# Altium schematic sheet Sheet1.SchDoc
size A2; SheetNumber: 1; SheetTotal: 1
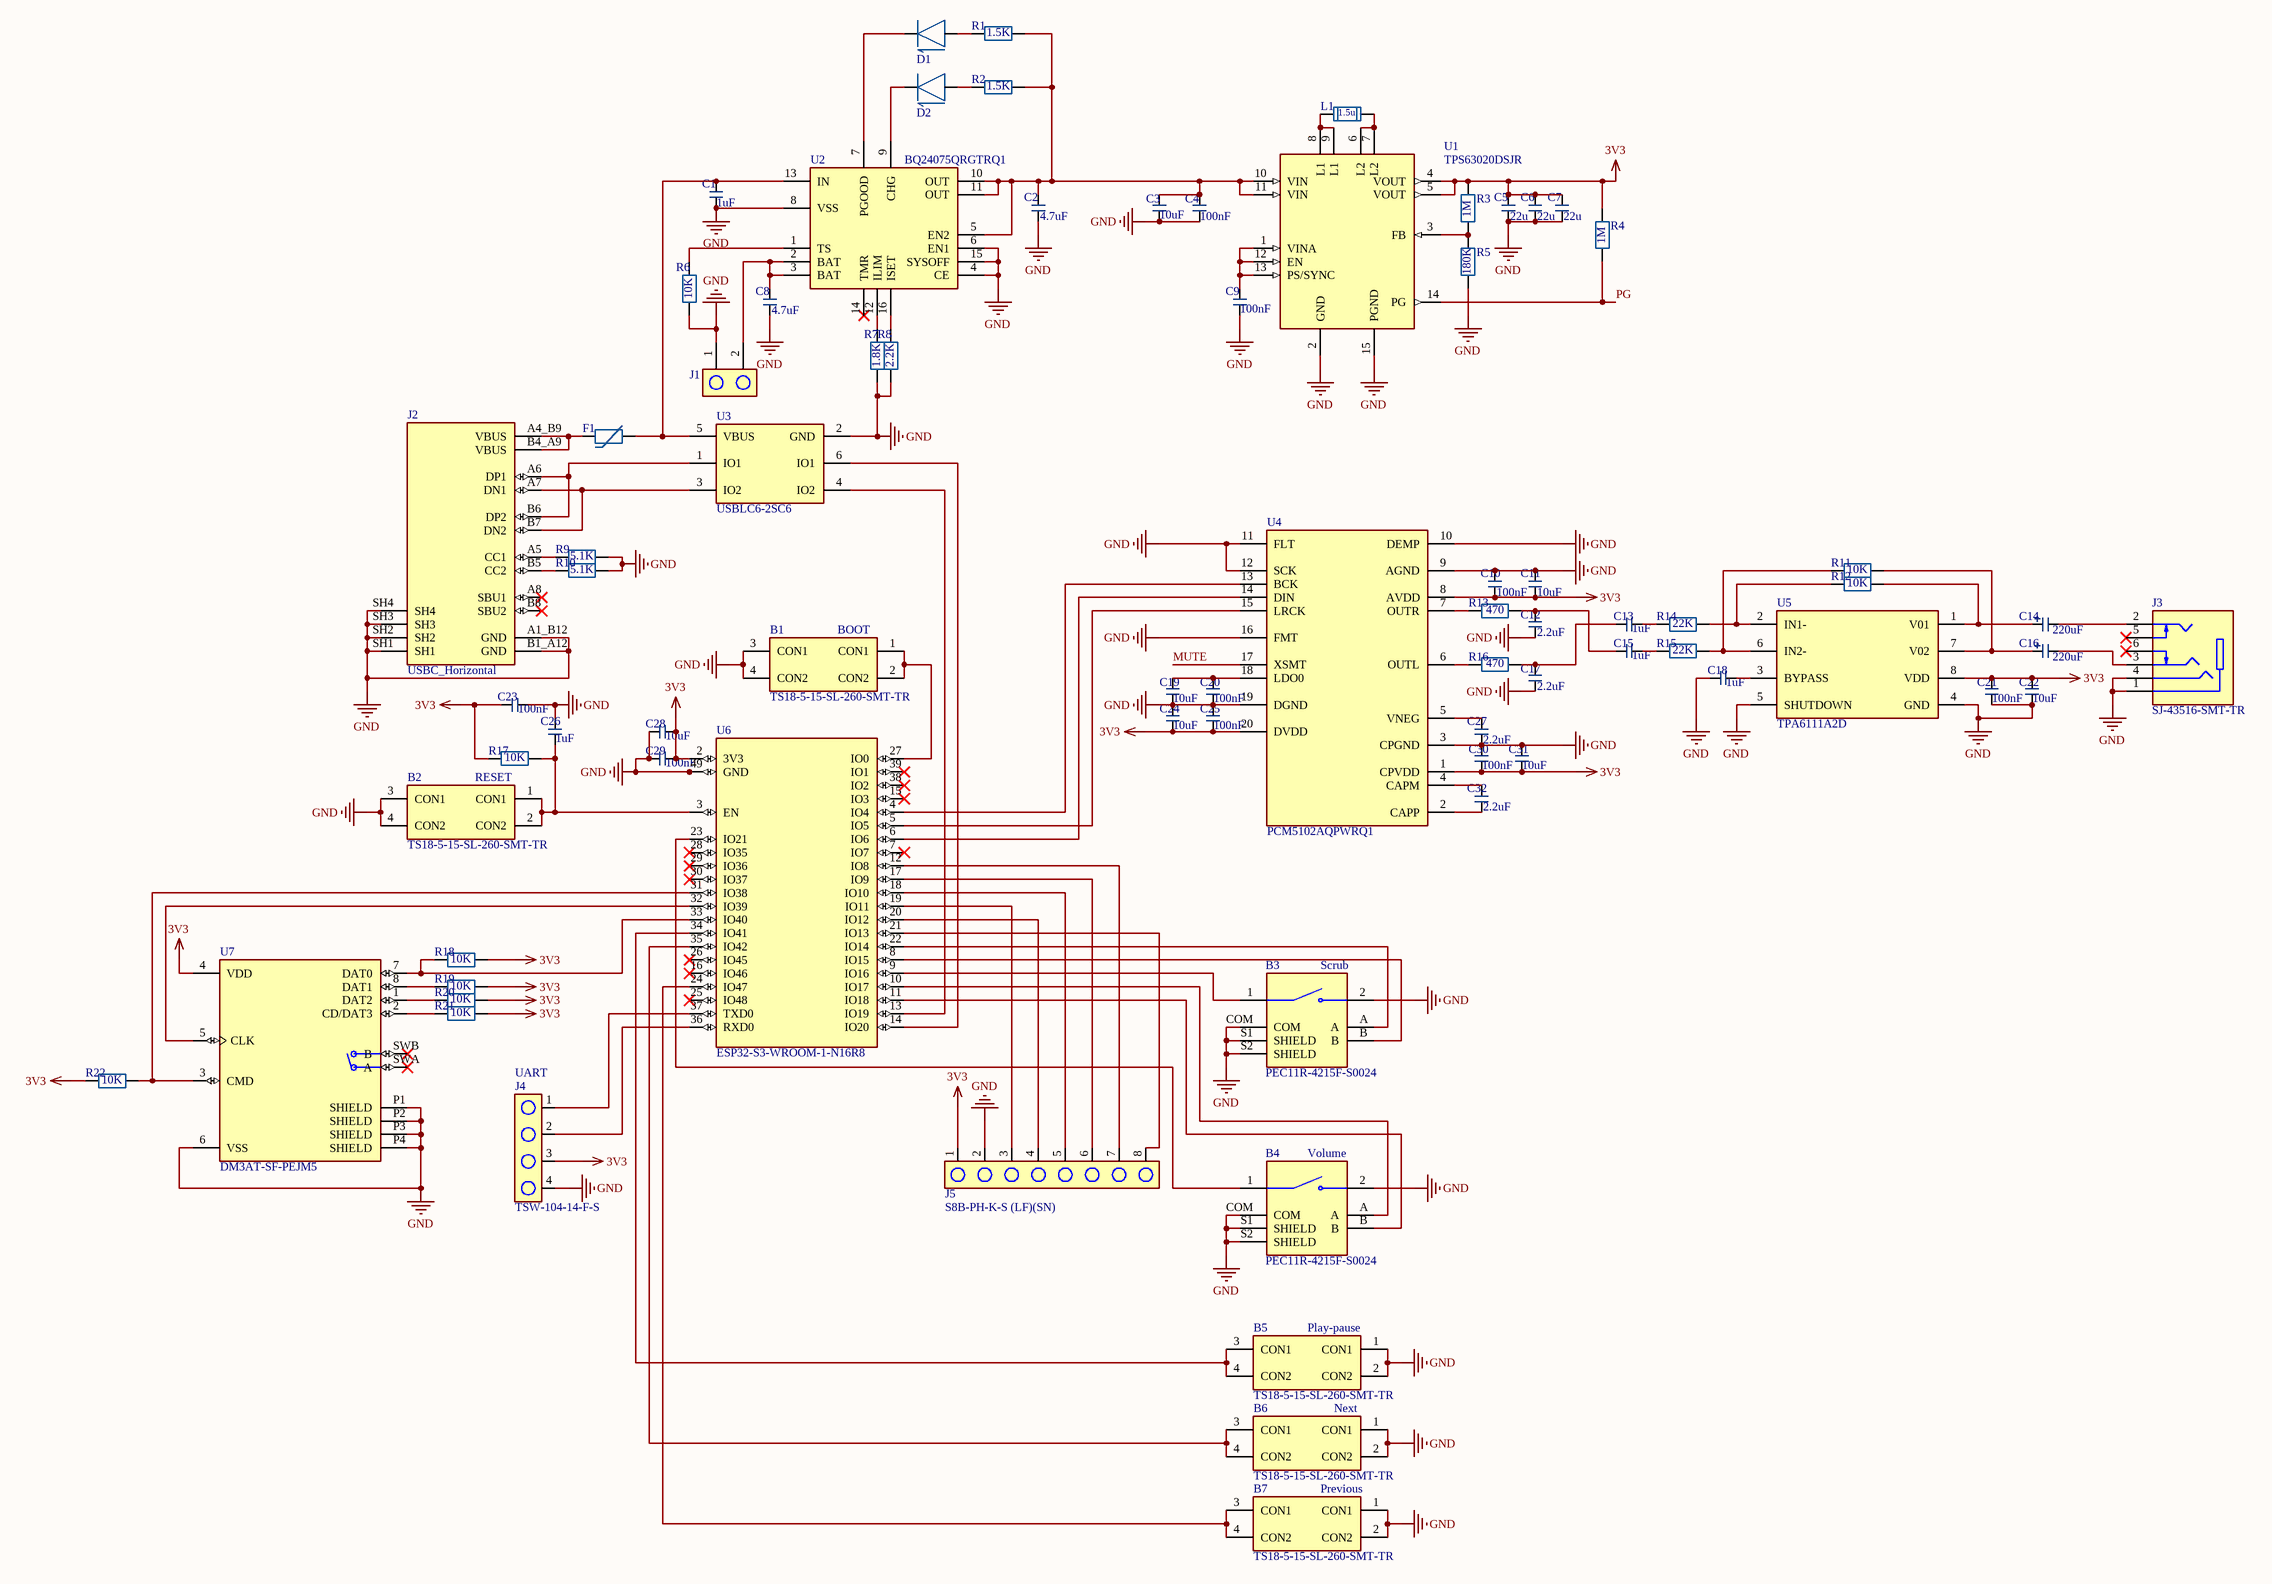
[diagram p0: Sheet1.SchDoc]

## Parts
B1  TS18-5-15-SL-260-SMT-TR  [TS18-5-15-SL-260-SMT-TR]
B2  TS18-5-15-SL-260-SMT-TR  [TS18-5-15-SL-260-SMT-TR]
B3  PEC11R-4215F-S0024  [PEC11R-4215F-S0024]
B4  PEC11R-4215F-S0024  [PEC11R-4215F-S0024]
B5  TS18-5-15-SL-260-SMT-TR  [TS18-5-15-SL-260-SMT-TR]
B6  TS18-5-15-SL-260-SMT-TR  [TS18-5-15-SL-260-SMT-TR]
B7  TS18-5-15-SL-260-SMT-TR  [TS18-5-15-SL-260-SMT-TR]
C1  1uF  [CAP_0603]
C2  4.7uF  [CAP_0603]
C3  10uF  [CAP_0603]
C4  100nF  [CAP_0603]
C5  22u  [CAP_0603]
C6  22u  [CAP_0603]
C7  22u  [CAP_0603]
C8  4.7uF  [CAP_0603]
C9  100nF  [CAP_0603]
C10  100nF  [CAP_0603]
C11  10uF  [CAP_0603]
C12  2.2uF  [CAP_0603]
C13  1uF  [CAP_0603]
C14  220uF  [865080345012_AluminiumCap]
C15  1uF  [CAP_0603]
C16  220uF  [865080345012_AluminiumCap]
C17  2.2uF  [CAP_0603]
C18  1uF  [CAP_0603]
C19  10uF  [CAP_0603]
C20  100nF  [CAP_0603]
C21  100nF  [CAP_0603]
C22  10uF  [CAP_0603]
C23  100nF  [CAP_0603]
C24  10uF  [CAP_0603]
C25  100nF  [CAP_0603]
C26  1uF  [CAP_0603]
C27  2.2uF  [CAP_0603]
C28  10uF  [CAP_0603]
C29  100nF  [CAP_0603]
C30  100nF  [CAP_0603]
C31  10uF  [CAP_0603]
C32  2.2uF  [CAP_0603]
D1  SML-LXIL0603SIC-TR  [LED_0603]  (value not drawn)
D2  SML-LXIL0603SIC-TR  [LED_0603]  (value not drawn)
F1  MF-PSMF050X-2  [MF-PSMF050X]  (value not drawn)
J1  TSW-102-07-G-S  [TSW-102-07-G-S]  (value not drawn)
J2  USBC_Horizontal  [USBC_Horizontal]
J3  SJ-43516-SMT-TR  [SJ-43516-SMT-TR]
J4  TSW-104-14-F-S  [TSW-104-14-F-S]
J5  S8B-PH-K-S (LF)(SN)  [S8B-PH-K-S (LF)(SN)]
L1  1.5u  [IND_0603]
R1  1.5K  [RES_0603]
R2  1.5K  [RES_0603]
R3  1M  [RES_0603]
R4  1M  [RES_0603]
R5  180K  [RES_0603]
R6  10K  [RES_0603]
R7  1.8K  [RES_0603]
R8  2.2K  [RES_0603]
R9  5.1K  [RES_0603]
R10  5.1K  [RES_0603]
R11  10K  [RES_0603]
R12  10K  [RES_0603]
R13  470  [RES_0603]
R14  22K  [RES_0603]
R15  22K  [RES_0603]
R16  470  [RES_0603]
R17  10K  [RES_0603]
R18  10K  [RES_0603]
R19  10K  [RES_0603]
R20  10K  [RES_0603]
R21  10K  [RES_0603]
R22  10K  [RES_0603]
U1  TPS63020DSJR  [TPS63020DSJR]
U2  BQ24075QRGTRQ1  [BQ24075QRGTRQ1]
U3  USBLC6-2SC6  [USBLC6-2SC6]
U4  PCM5102AQPWRQ1  [PCM5102AQPWRQ1]
U5  TPA6111A2D  [TPA6111A2D]
U6  ESP32-S3-WROOM-1-N16R8  [ESP32-S3-WROOM-1-N16R8]
U7  DM3AT-SF-PEJM5

## Nets
3V3: C5.2 C6.2 C7.2 C10.1 C11.1 C21.1 C22.2 C23.1 C24.1 C25.1 C28.2 C29.2 C30.1 C31.1 J4.3 J5.1 R3.2 R4.2 R17.1 R18.2 R19.1 R20.1 R21.1 R22.1 U1.4(VOUT) U1.5(VOUT) U4.1(CPVDD) U4.8(AVDD) U4.20(DVDD) U5.8(VDD) U6.2(3V3) U7.4(VDD)
GND: B1.3(CON1) B1.4(CON2) B2.3(CON1) B2.4(CON2) B3.2 B3.COM B3.S1(SHIELD) B3.S2(SHIELD) B4.2 B4.COM B4.S1(SHIELD) B4.S2(SHIELD) B5.1(CON1) B5.2(CON2) B6.1(CON1) B6.2(CON2) B7.1(CON1) B7.2(CON2) C1.1 C2.1 C3.1 C4.1 C5.1 C6.1 C7.1 C8.1 C9.1 C10.2 C11.2 C12.1 C17.1 C18.1 C19.1 C20.1 C21.2 C22.1 C23.2 C24.2 C25.2 C26.2 C27.1 C28.1 C29.1 C30.2 C31.2 J1.1 J2.A1_B12(GND) J2.B1_A12(GND) J2.SH1 J2.SH2 J2.SH3 J2.SH4 J3.1 J3.4 J4.4 J5.2 R5.1 R6.1 R7.1 R8.1 R9.2 R10.2 U1.2(GND) U1.15(PGND) U2.4(CE) U2.6(EN1) U2.8(VSS) U2.15(SYSOFF) U3.2(GND) U4.3(CPGND) U4.9(AGND) U4.10(DEMP) U4.11(FLT) U4.12(SCK) U4.16(FMT) U4.19(DGND) U5.4(GND) U5.5(SHUTDOWN) U6.1(GND) U6.40(GND) U6.41(GND) U6.42(GND) U6.43(GND) U6.44(GND) U6.45(GND) U6.46(GND) U6.47(GND) U6.48(GND) U6.49(GND) U7.6(VSS) U7.P1(SHIELD) U7.P2(SHIELD) U7.P3(SHIELD) U7.P4(SHIELD)
MUTE: U4.17(XSMT)
PG: R4.1 U1.14(PG)
NetB1_1: B1.1(CON1) B1.2(CON2) U6.27(IO0)
NetB2_1: B2.1(CON1) B2.2(CON2) C26.1 R17.2 U6.3(EN)
NetB3_1: B3.1 U6.9(IO16)
NetB3_A: B3.A U6.22(IO14)
NetB3_B: B3.B U6.8(IO15)
NetB4_1: B4.1 U6.23(IO21)
NetB4_A: B4.A U6.10(IO17)
NetB4_B: B4.B U6.11(IO18)
NetB5_3: B5.3(CON1) B5.4(CON2) U6.34(IO41)
NetB6_3: B6.3(CON1) B6.4(CON2) U6.35(IO42)
NetB7_3: B7.3(CON1) B7.4(CON2) U6.24(IO47)
NetC1_2: C1.2 F1.2 U2.13(IN) U3.5(VBUS)
NetC2_2: C2.2 C3.2 C4.2 R1.2 R2.2 U1.10(VIN) U1.11(VIN) U2.5(EN2) U2.10(OUT) U2.11(OUT)
NetC8_2: C8.2 J1.2 U2.2(BAT) U2.3(BAT)
NetC9_2: C9.2 U1.1(VINA) U1.12(EN) U1.13(PS/SYNC)
NetC12_2: C12.2 C15.1 R13.2
NetC13_1: C13.1 C17.2 R16.2
NetC13_2: C13.2 R14.1
NetC14_1: C14.1 R12.2 U5.1(V01)
NetC14_2: C14.2 J3.2
NetC15_2: C15.2 R15.1
NetC16_1: C16.1 R11.2 U5.7(V02)
NetC16_2: C16.2 J3.3
NetC18_2: C18.2 U5.3(BYPASS)
NetC19_2: C19.2 C20.2 U4.18(LDO0)
NetC27_2: C27.2 U4.5(VNEG)
NetC32_1: C32.1 U4.2(CAPP)
NetC32_2: C32.2 U4.4(CAPM)
NetD1_1: D1.1 R1.1
NetD1_2: D1.2 U2.7(PGOOD)
NetD2_1: D2.1 R2.1
NetD2_2: D2.2 U2.9(CHG)
NetF1_1: F1.1 J2.A4_B9(VBUS) J2.B4_A9(VBUS)
NetJ2_A5: J2.A5(CC1) R9.1
NetJ2_A6: J2.A6(DP1) J2.B6(DP2) U3.1(IO1)
NetJ2_A7: J2.A7(DN1) J2.B7(DN2) U3.3(IO2)
NetJ2_B5: J2.B5(CC2) R10.1
NetJ4_1: J4.1 U6.37(TXD0)
NetJ4_2: J4.2 U6.36(RXD0)
NetJ5_3: J5.3 U6.19(IO11)
NetJ5_4: J5.4 U6.20(IO12)
NetJ5_5: J5.5 U6.18(IO10)
NetJ5_6: J5.6 U6.17(IO9)
NetJ5_7: J5.7 U6.12(IO8)
NetJ5_8: J5.8 U6.21(IO13)
NetL1_1: L1.1 U1.8(L1) U1.9(L1)
NetL1_2: L1.2 U1.6(L2) U1.7(L2)
NetR3_1: R3.1 R5.2 U1.3(FB)
NetR6_2: R6.2 U2.1(TS)
NetR7_2: R7.2 U2.12(ILIM)
NetR8_2: R8.2 U2.16(ISET)
NetR11_1: R11.1 R15.2 U5.6(IN2-)
NetR12_1: R12.1 R14.2 U5.2(IN1-)
NetR13_1: R13.1 U4.7(OUTR)
NetR16_1: R16.1 U4.6(OUTL)
NetR18_1: R18.1 U6.33(IO40) U7.7(DAT0)
NetR19_2: R19.2 U7.8(DAT1)
NetR20_2: R20.2 U7.1(DAT2)
NetR21_2: R21.2 U7.2(CD/DAT3)
NetR22_2: R22.2 U6.31(IO38) U7.3(CMD)
NetU3_4: U3.4(IO2) U6.13(IO19)
NetU3_6: U3.6(IO1) U6.14(IO20)
NetU4_13: U4.13(BCK) U6.4(IO4)
NetU4_14: U4.14(DIN) U6.6(IO6)
NetU4_15: U4.15(LRCK) U6.5(IO5)
NetU6_32: U6.32(IO39) U7.5(CLK)

Not connected (* = marked no-connect by the designer): J2 A8(SBU1)* B8(SBU2)*; J3 5* 6*; U2 14(TMR)*; U6 7(IO7)* 15(IO3)* 16(IO46)* 25(IO48)* 26(IO45)* 28(IO35)* 29(IO36)* 30(IO37)* 38(IO2)* 39(IO1)*; U7 SWA(A)* SWB(B)*

## Notes on the sheet
- (near B1) BOOT
- RESET
- (near B3) Scrub
- (near J4) UART
- (near B4) Volume
- (near B5) Play-pause
- (near B6) Next
- (near B7) Previous

## Library data of the parts
B1 B2 = TS18-5-15-SL-260-SMT-TR: Push-button style, NO; Manufacturer: SameSky; Supplier 1: Mouser; Supplier Part Number 1: 179-TS18515SL260SMTT; Supplier 2: DigiKey; Supplier Part Number 2: 2223-TS18-5-15-SL-260-SMT-TRDKR-ND; Manufacturer Part Number: TS18-5-15-SL-260-SMT-TR
B3 B4 = PEC11R-4215F-S0024: Rotary Encoder; Manufacturer: Bourns; Supplier 1: Mouser; Supplier Part Number 1: 652-PEC11R-4215F-S24; Supplier 2: DigiKey; Supplier Part Number 2: PEC11R-4215F-S0024-ND; Manufacturer Part Number: PEC11R-4215F-S0024
B5-B7 = TS18-5-15-SL-260-SMT-TR: Push-button style, NO
C1 C13 C15 C18 C26 = C_1u_0603: 1 uF 10% 0603 X7R MLCC; Manufacturer: Yageo; Manufacturer Part Number: CC0603KRX7R7BB105; Package (Imperial): 0603; Voltage Rating DC: 16 VDC; Value: 1 uF; Tolerance: 10%; Dielectric: X7R; Datasheet: https://yageogroup.com/component-documentation/download/datasheet/CC0603KRX7R7BB105?lang=en; Supplier 1: Mouser; Supplier Part Number 1: 603-CC603KRX7R7BB105; Supplier 2: DigiKey; Supplier Part Number 2: 311-1446-1-ND
C2 C8 = C_4.7u_0805: 4.7 uF 10% 0805 X7R MLCC; Manufacturer: Yageo (KEMET); Manufacturer Part Number: C0805C475K3RAC7210; Package (Imperial): 0805; Voltage Rating DC: 16 VDC; Value: 4.7 uF; Tolerance: 10%; Dielectric: X7R; Datasheet: https://yageogroup.com/component-documentation/download/datasheet/C0805C475K4RACTM?lang=en; Supplier 1: Mouser; Supplier Part Number 1: 80-C0805C475K3RACLR; Supplier 2: DigiKey; Supplier Part Number 2: 399-C0805C475K3RAC7210TR-ND
C3 C19 C22 C24 C31 = C_10u_0805: 10 uF 10% 0805 X7R MLCC; Manufacturer Part Number: C0805C106K8RACTU; Manufacturer: Yageo; Package (Imperial): 0805; Voltage Rating DC: 10 VDC; Tolerance: 10%; Dielectric: X7R; Datasheet: https://yageogroup.com/component-documentation/download/datasheet/C0805C106K8RACTU?lang=en; Value: 10 uF; Supplier 1: Mouser; Supplier Part Number 1: 80-C0805C106K8R; Supplier 2: DigiKey; Supplier Part Number 2: 399-C0805C106K8RACTUCT-ND
C4 C9 C10 C20 C21 C23 C25 C29 C30 = C_100n_0603: 100 nF 1% 0603 X7R MLCC; Manufacturer: Yageo; Manufacturer Part Number: CC0603KRX7R9BB104; Package (Imperial): 0603; Voltage Rating DC: 50 VDC; Value: 100 nF; Tolerance: 1%; Dielectric: X7R; Datasheet: https://yageogroup.com/component-documentation/download/datasheet/CC0603KRX7R9BB104?lang=en
  C4: Supplier 1: Mouser; Supplier Part Number 1: 603-CC603KRX7R9BB104; Supplier 2: DigiKey; Supplier Part Number 2: 311-1344-6-ND
C5-C7 = C_22u_0603: 22 uF 20% 0603 X5R MLCC; Manufacturer: Yageo; Manufacturer Part Number: CC0603MRX5R6BB226; Value: 22 uF; Package (Imperial): 0603; Voltage Rating DC: 10 VDC; Tolerance: 20%; Dielectric: X5R; ComponentLink1Description: Datasheet; ComponentLink1URL: https://yageogroup.com/component-documentation/download/datasheet/CC0603MRX5R6BB226?lang=en; Supplier 1: Mouser; Supplier Part Number 1: 603-CC603MRX5R6BB226; Supplier 2: DigiKey; Supplier Part Number 2: 311-1819-1-ND
C11 C28 = C_10u_0805: 10 uF 10% 0805 X7R MLCC; Manufacturer: Yageo; Manufacturer Part Number: C0805C106K8RACTU; Package (Imperial): 0805; Voltage Rating DC: 10 VDC; Value: 10 uF; Tolerance: 10%; Dielectric: X7R; Datasheet: https://yageogroup.com/component-documentation/download/datasheet/C0805C106K8RACTU?lang=en
C12 C17 C27 C32 = C_2.2u_0603: 2.2 uF 10% 0603 X7R MLCC; Manufacturer: Yageo; Manufacturer Part Number: CC0603KRX7R7BB225; Package (Imperial): 0603; Voltage Rating DC: 16 VDC; Value: 2.2 uF; Tolerance: 10%; Dielectric: X7R; Datasheet: *
  C12 C17: Supplier 1: Mouser; Supplier Part Number 1: 603-CC0603KRX77BB225; Supplier 2: DigiKey; Supplier Part Number 2: 311-3490-6-ND
C14 C16 = C_220u_ALUMINIUM: 220 uF 20% Radial Electrolytic Aluminium Capacitor; Manufacturer: Wurth Elektronik; Manufacturer Part Number: 865080345012; Package (Imperial): Radial, Can - SMD; Voltage Rating DC: 16 V; Value: 220 uF; Tolerance: 20%; Dielectric: Electrolytic; ComponentLink1Description: Datasheet; ComponentLink1URL: https://www.we-online.com/components/products/datasheet/865080345012.pdf; Supplier 1: Mouser; Supplier Part Number 1: 710-865080345012; Supplier 2: DigiKey; Supplier Part Number 2: 732-8422-1-ND
D1 D2 = SML-LXIL0603SIC-TR: Single Color Red LED 0603; Manufacturer: Lumex; Wavelength: 630 nm; Manufacturer Part Number: SML-LXIL0603SIC-TR; Package: 0603; Supplier 1: Mouser; Supplier Part Number 1: 696-SMLLXIL0603SICTR; Supplier 2: DigiKey; Supplier Part Number 2: 67-2333-1-ND; ComponentLink1Description: Datasheet; ComponentLink1URL: https://www.lumex.com/datasheet/files/SML-LX0603IW-TR.pdf
F1 = MF-PSMF050X-2: PPTC 1V 0.5A; Manufacturer: Bourns; Package (Imperial): 0805; Hold Current: 500 mA; Trip Current: 1 A; Maximum Current: 40 A; Maximum Voltage: 6 VDC; Manufacturer Part Number: MF-PSMF050X-2; Termination: Recessed SMD; Supplier 1: Mouser; Supplier Part Number 1: 652-MF-PSMF050X-2; Supplier 2: DigiKey; Supplier Part Number 2: MF-PSMF050X-2CT-ND
J1 = TSW-102-07-G-S: 1x2 Headers 2.54 Pitch; Manufacturer: Samtec; Number of Positions: 2; Pitch: 2.54 mm; Manufacturer Part Number: TSW-102-07-G-S; Number of Rows: 1; Supplier 1: Mouser; Supplier Part Number 1: 200-TSW10207GS; Supplier 2: DigiKey; Supplier Part Number 2: 612-TSW-102-07-G-S-ND; ComponentLink1Description: Datasheet; ComponentLink1URL: https://www.mouser.in/datasheet/3/85/1/htsw_th.pdf
J2 = USBC_Horizontal: USB-C, USB-2.0 SMD 16 contacts, horizontal; Manufacturer: GCT; Manufacturer Part Number: USB4105GFA; Number of Contacts: 16; Current Rating: 5 A; Voltage Rating: 48 VDC; Standard: USB-2.0; Termination: SMD; Supplier 1: Mouser; Supplier Part Number 1: 640-USB4105-GF-A; Supplier 2: DigiKey; Supplier Part Number 2: 2073-USB4105-GF-ADKR-ND
J3 = SJ-43516-SMT-TR: 6-pin Audio Jack, 3.5mm; Manufacturer: SameSky; Number of Positions: 1; Supplier 1: Mouser; Supplier Part Number 1: 490-SJ-43516-SMT-TR; Supplier 2: DigiKey; Supplier Part Number 2: CP-43516SJDKR-ND; Manufacturer Part Number: SJ-43516-SMT-TR; Number of Rows: 1; Pitch: -
J4 = TSW-104-14-F-S: 1x4 Headers 2.54 Pitch; Manufacturer: Samtec; Number of Positions: 4; Pitch: 2.54 mm; Supplier 1: Mouser; Supplier Part Number 1: 200-TSW10414FS; Supplier 2: DigiKey; Supplier Part Number 2: SAM15369-ND; Manufacturer Part Number: TSW-104-14-F-S; Number of Rows: 1
J5 = S8B-PH-K-S (LF)(SN): 1x8 JST PH2.0 Header; Manufacturer: JST Commercial; Number of Positions: 8; Supplier 1: Future Electronics; Supplier Part Number 1: S8B-PH-K-S(LF)(SN); Supplier 2: Mouser; Supplier Part Number 2: 306-S8BPHKSLFSN; Manufacturer Part Number: S8B-PH-K-S (LF)(SN); Number of Rows: 1; Pitch: -
L1 = I_1.5u_0603: 1.5 uH 20% 0603 inductor; Manufacturer: Murata; Manufacturer Part Number: LQM18PH1R5MFCL; Value: 1.5 uH; Package (Imperial): 0603; Saturation Current: 600 mA; Tolerance: 20%; Supplier 1: Mouser; Supplier Part Number 1: 81-LQM18PH1R5MFCL; Supplier 2: DigiKey; Supplier Part Number 2: 490-LQM18PH1R5MFCLCT-ND
R1 R2 = R_1.5K_0603: 1.5 kOhm 1% resistor; Manufacturer: Yageo; Manufacturer Part Number: RC0603FR-071K5L; Package (Imperial): 0603; Power Rating: 0.1 W; Voltage Rating: 75 V; Value: 1.5 kOhm; Tolerance: 1%; ComponentLink1Description: Datasheet; ComponentLink1URL: https://yageogroup.com/component-documentation/download/datasheet/RC0603FR-071K5L?lang=en; Supplier 1: Mouser; Supplier Part Number 1: 603-RC0603FR-071K5L; Supplier 2: Future Electronics; Supplier Part Number 2: RC0603FR-071K5L
R3 R4 = R_1M_0603: 1 MOhm 1% 0603 resistor; Manufacturer: Yageo; Manufacturer Part Number: RC0603FR-071ML; Value: 1 MOhm; Package (Imperial): 0603; Power Rating: 0.1 W; Voltage Rating: 75 V; Tolerance: 1%; ComponentLink1Description: Datasheet; ComponentLink1URL: https://yageogroup.com/component-documentation/download/datasheet/RC0603FR-071ML?lang=en
R5 = R_180K_0603: 180 kOhm 1% 0603; Manufacturer: Yageo; Manufacturer Part Number: RC0603FR-07180KL; Package (Imperial): 0603; Power Rating: 0.1 W; Voltage Rating: 75 V; Value: 180 kOhm; Tolerance: 1%; ComponentLink1Description: Datasheet; ComponentLink1URL: https://yageogroup.com/component-documentation/download/datasheet/RC0603FR-07180KL?lang=en; Supplier 1: Mouser; Supplier Part Number 1: 603-RC0603FR-07180KL; Supplier 2: DigiKey; Supplier Part Number 2: 311-180KHRCT-ND
R6 R11 R12 R17-R22 = R_10K_0603: 10 kOhm 1% 0603 resistor; Manufacturer: Yageo; Manufacturer Part Number: RC0603FR-0710KL; Value: 10 kOhm; Package (Imperial): 0603; Power Rating: 0.1 W; Voltage Rating: 75 V; Tolerance: 1%; ComponentLink1Description: Datasheet; ComponentLink1URL: https://yageogroup.com/component-documentation/download/datasheet/RC0603FR-0710KL?lang=en
R7 = R_1.8K_0603: 1.8 kOhm 1% resistor; Manufacturer: Yageo; Manufacturer Part Number: RC0603FR-071K8L; Package (Imperial): 0603; Power Rating: 0.1 W; Voltage Rating: 75 V; Value: 1.8 kOhm; Tolerance: 1%; ComponentLink1Description: Datasheet; ComponentLink1URL: https://yageogroup.com/component-documentation/download/datasheet/RC0603FR-071K8L?lang=en; Supplier 1: Mouser; Supplier Part Number 1: 603-RC0603FR-071K8L; Supplier 2: DigiKey; Supplier Part Number 2: 311-1.80KHRCT-ND
R8 = R_2.2K_0603: 2.2 kOhm 1% resistor; Manufacturer: Yageo; Manufacturer Part Number: RC0603FR-072K2L; Package (Imperial): 0603; Power Rating: 0.1 W; Voltage Rating: 75 V; Value: 2.2 kOhm; Tolerance: 1%; ComponentLink1Description: Datasheet; ComponentLink1URL: https://yageogroup.com/component-documentation/download/datasheet/RC0603FR-072K2L?lang=en; Supplier 1: Mouser; Supplier Part Number 1: 603-RC0603FR-072K2L; Supplier 2: Future Electronics; Supplier Part Number 2: RC0603FR-072K2L
R9 R10 = R_5.1K_0603: 5.1 kOhm 1% 0603 resistor; Manufacturer: Yageo; Manufacturer Part Number: RC0603FR-075K1L; Package (Imperial): 0603; Power Rating: 0.1 W; Voltage Rating: 75 V; Value: 5.1 kOhm; Tolerance: 1%; ComponentLink1Description: Datasheet; ComponentLink1URL: https://yageogroup.com/content/datasheet/asset/file/PYU-RC_GROUP_51_ROHS_L; Supplier 1: Mouser; Supplier Part Number 1: 603-RC0603FR-075K1L; Supplier 2: DigiKey; Supplier Part Number 2: 311-5.10KHRCT-ND
R13 R16 = R_470_0603: 470 Ohm 1% 0603 resistor; Manufacturer: Yageo; Manufacturer Part Number: RC0603FR-07470RL; Value: 470 Ohm; Package (Imperial): 0603; Power Rating: 0.1 W; Voltage Rating: 75 V; Tolerance: 1%; ComponentLink1Description: Datasheet; ComponentLink1URL: https://yageogroup.com/component-documentation/download/datasheet/RC0603FR-07470RL?lang=en; Supplier 1: Mouser; Supplier Part Number 1: 603-RC0603FR-07470RL; Supplier 2: DigiKey; Supplier Part Number 2: 311-470HRDKR-ND
R14 R15 = R_22K_0603: 22 kOhm 1% 0603 resistor; Manufacturer: Yageo; Manufacturer Part Number: RC0603FR-0722KL; Value: 22 kOhm; Package (Impeprial): 0603; Power Rating: 0.1 W; Voltage Rating: 75 V; Tolerance: 1%; ComponentLink1Description: Datasheet; ComponentLink1URL: https://yageogroup.com/component-documentation/download/datasheet/RC0603FR-071K8L?lang=en; Supplier 1: Mouser; Supplier Part Number 1: 603-RC0603FR-0722KL; Supplier 2: DigiKey; Supplier Part Number 2: 311-22.0KHRDKR-ND
U1 = TPS63020DSJR: Switching Voltage Regulator; Manufacturer: Texas Instruments; Topology: Buck-Boost; Input Voltage: 1.8 V - 5.5 V; Output Voltage: 1.2 V - 5.5 V; Output Current: 4 A; Supplier 1: Mouser; Supplier Part Number 1: 595-TPS63020DSJR; Supplier 2: DigiKey; Supplier Part Number 2: 296-36491-6-ND; Manufacturer Part Number: TPS63020DSJR; Package: VSON-14
U2 = BQ24075QRGTRQ1: USB-BMS PMIC; Supplier 1: Mouser; Supplier Part Number 1: 595-BQ24075QRGTRQ1; Supplier 2: DigiKey; Supplier Part Number 2: 296-36557-2-ND
U3 = USBLC6-2SC6: Dual-line ESD Surge Protector, 0.6 pF; Manufacturer: STMicroelectronics; Manufacturer Part Number: USBLC6-2SC6; Package: SOT-23-6; Topology: -; Input Voltage: -; Output Voltage: -; Output Current: -; Supplier 1: Mouser; Supplier Part Number 1: 511-USBLC6-2SC6; Supplier 2: DigiKey; Supplier Part Number 2: 497-5235-6-ND
U4 = PCM5102AQPWRQ1: DAC; Supplier 1: Mouser; Supplier Part Number 1: 595-PCM5102AQPWRQ1; Supplier 2: DigiKey; Supplier Part Number 2: 296-37277-1-ND
U5 = TPA6111A2D: Audio Amplifier; Manufacturer: Texas Instruments; Manufacturer Part Number: TPA6111A2D; ComponentLink1Description: Datasheet; ComponentLink1URL: https://www.ti.com/lit/gpn/tpa6111a2; Supplier 1: Mouser; Supplier Part Number 1: 595-TPA6111A2D; Supplier 2: DigiKey; Supplier Part Number 2: 296-26887-5-ND
U6 = ESP32-S3-WROOM-1-N16R8: Manufacturer: Espressif; Input Voltage: 3-3.6 V; Operating Voltage: 3.3 V; Manufacturer Part Number: ESP32-S3-WROOM-1-N16R8; Package: SMD Module; Topology: -; Output Voltage: -; Output Current: -; Supplier 1: Mouser; Supplier Part Number 1: 356-ESP32S3WRM1N16R8; Supplier 2: Future Electronics; Supplier Part Number 2: ESP32-S3-WROOM-1-N16R8
U7 = DM3AT-SF-PEJM5: SD Card; Supplier 1: Mouser; Supplier Part Number 1: 798-DM3AT-SF-PEJM5; Supplier 2: DigiKey; Supplier Part Number 2: HR1964DKR-ND